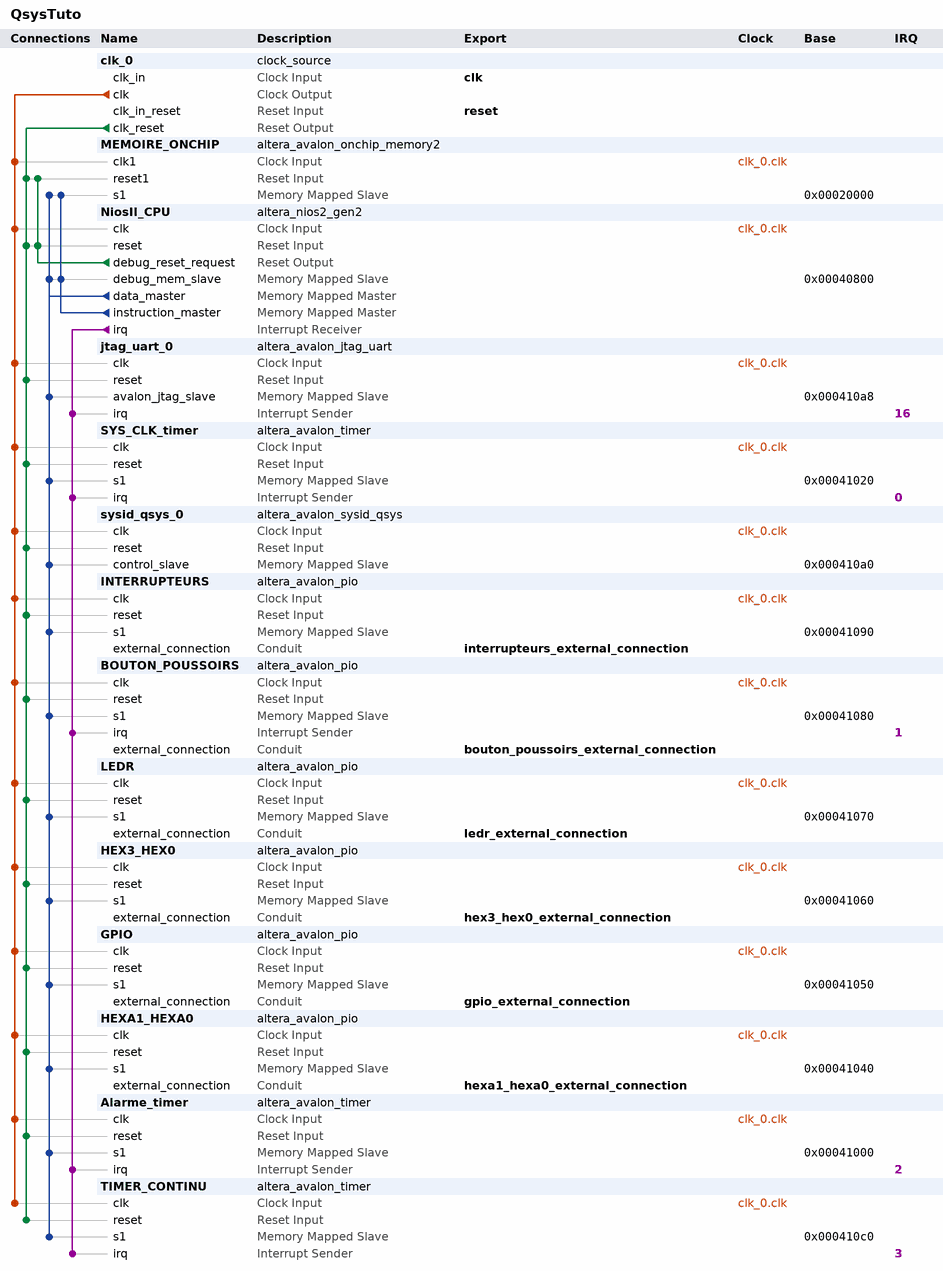
[diagram p0: system contents]
# Platform Designer (Qsys) system QsysTuto, MAX 10 10M50DAF484C6GES
# Parameters at their usual value, and those the tool derives, are not listed.
package require -exact qsys 18.1
create_system QsysTuto
set_project_property DEVICE_FAMILY {MAX 10}
set_project_property DEVICE 10M50DAF484C6GES

add_instance clk_0 clock_source 18.1
set_instance_parameter_value clk_0 clockFrequency 50000000

add_instance MEMOIRE_ONCHIP altera_avalon_onchip_memory2 18.1
set_instance_parameter_value MEMOIRE_ONCHIP dataWidth 32
set_instance_parameter_value MEMOIRE_ONCHIP dualPort false
set_instance_parameter_value MEMOIRE_ONCHIP initMemContent false
set_instance_parameter_value MEMOIRE_ONCHIP initializationFileName onchip_mem.hex
set_instance_parameter_value MEMOIRE_ONCHIP memorySize 122880

add_instance NiosII_CPU altera_nios2_gen2 18.1
set_instance_parameter_value NiosII_CPU dcache_size 0
set_instance_parameter_value NiosII_CPU exceptionSlave MEMOIRE_ONCHIP.s1
set_instance_parameter_value NiosII_CPU icache_size 2048
set_instance_parameter_value NiosII_CPU impl Fast
set_instance_parameter_value NiosII_CPU resetSlave MEMOIRE_ONCHIP.s1
set_instance_parameter_value NiosII_CPU setting_branchpredictiontype Static

add_instance jtag_uart_0 altera_avalon_jtag_uart 18.1
set_instance_parameter_value jtag_uart_0 simInteractiveOptions NO_INTERACTIVE_WINDOWS

add_instance SYS_CLK_timer altera_avalon_timer 18.1
set_instance_parameter_value SYS_CLK_timer period 1
set_instance_parameter_value SYS_CLK_timer periodUnits MSEC

add_instance sysid_qsys_0 altera_avalon_sysid_qsys 18.1
set_instance_parameter_value sysid_qsys_0 id 305419896

add_instance INTERRUPTEURS altera_avalon_pio 18.1
set_instance_parameter_value INTERRUPTEURS direction Input
set_instance_parameter_value INTERRUPTEURS width 10

add_instance BOUTON_POUSSOIRS altera_avalon_pio 18.1
set_instance_parameter_value BOUTON_POUSSOIRS captureEdge true
set_instance_parameter_value BOUTON_POUSSOIRS direction Input
set_instance_parameter_value BOUTON_POUSSOIRS edgeType FALLING
set_instance_parameter_value BOUTON_POUSSOIRS generateIRQ true
set_instance_parameter_value BOUTON_POUSSOIRS irqType EDGE
set_instance_parameter_value BOUTON_POUSSOIRS width 2

add_instance LEDR altera_avalon_pio 18.1
set_instance_parameter_value LEDR direction Output
set_instance_parameter_value LEDR resetValue 597
set_instance_parameter_value LEDR width 10

add_instance HEX3_HEX0 altera_avalon_pio 18.1
set_instance_parameter_value HEX3_HEX0 direction Output
set_instance_parameter_value HEX3_HEX0 resetValue 1077952576
set_instance_parameter_value HEX3_HEX0 width 32

add_instance GPIO altera_avalon_pio 18.1
set_instance_parameter_value GPIO direction Output
set_instance_parameter_value GPIO width 1

add_instance HEXA1_HEXA0 altera_avalon_pio 18.1
set_instance_parameter_value HEXA1_HEXA0 direction Output
set_instance_parameter_value HEXA1_HEXA0 resetValue 16448
set_instance_parameter_value HEXA1_HEXA0 width 16

add_instance Alarme_timer altera_avalon_timer 18.1
set_instance_parameter_value Alarme_timer period 1
set_instance_parameter_value Alarme_timer periodUnits MSEC

add_instance TIMER_CONTINU altera_avalon_timer 18.1
set_instance_parameter_value TIMER_CONTINU period 1
set_instance_parameter_value TIMER_CONTINU periodUnits MSEC

# connections
add_connection clk_0.clk Alarme_timer.clk clock
add_connection clk_0.clk BOUTON_POUSSOIRS.clk clock
add_connection clk_0.clk GPIO.clk clock
add_connection clk_0.clk HEX3_HEX0.clk clock
add_connection clk_0.clk HEXA1_HEXA0.clk clock
add_connection clk_0.clk INTERRUPTEURS.clk clock
add_connection clk_0.clk jtag_uart_0.clk clock
add_connection clk_0.clk LEDR.clk clock
add_connection clk_0.clk MEMOIRE_ONCHIP.clk1 clock
add_connection clk_0.clk NiosII_CPU.clk clock
add_connection clk_0.clk SYS_CLK_timer.clk clock
add_connection clk_0.clk sysid_qsys_0.clk clock
add_connection clk_0.clk TIMER_CONTINU.clk clock
add_connection clk_0.clk_reset Alarme_timer.reset reset
add_connection clk_0.clk_reset BOUTON_POUSSOIRS.reset reset
add_connection clk_0.clk_reset GPIO.reset reset
add_connection clk_0.clk_reset HEX3_HEX0.reset reset
add_connection clk_0.clk_reset HEXA1_HEXA0.reset reset
add_connection clk_0.clk_reset INTERRUPTEURS.reset reset
add_connection clk_0.clk_reset jtag_uart_0.reset reset
add_connection clk_0.clk_reset LEDR.reset reset
add_connection clk_0.clk_reset MEMOIRE_ONCHIP.reset1 reset
add_connection clk_0.clk_reset NiosII_CPU.reset reset
add_connection clk_0.clk_reset SYS_CLK_timer.reset reset
add_connection clk_0.clk_reset sysid_qsys_0.reset reset
add_connection clk_0.clk_reset TIMER_CONTINU.reset reset
add_connection NiosII_CPU.debug_reset_request MEMOIRE_ONCHIP.reset1 reset
add_connection NiosII_CPU.debug_reset_request NiosII_CPU.reset reset
add_connection NiosII_CPU.data_master Alarme_timer.s1 avalon
set_connection_parameter_value NiosII_CPU.data_master/Alarme_timer.s1 baseAddress 0x00041000
add_connection NiosII_CPU.data_master BOUTON_POUSSOIRS.s1 avalon
set_connection_parameter_value NiosII_CPU.data_master/BOUTON_POUSSOIRS.s1 baseAddress 0x00041080
add_connection NiosII_CPU.data_master GPIO.s1 avalon
set_connection_parameter_value NiosII_CPU.data_master/GPIO.s1 baseAddress 0x00041050
add_connection NiosII_CPU.data_master HEX3_HEX0.s1 avalon
set_connection_parameter_value NiosII_CPU.data_master/HEX3_HEX0.s1 baseAddress 0x00041060
add_connection NiosII_CPU.data_master HEXA1_HEXA0.s1 avalon
set_connection_parameter_value NiosII_CPU.data_master/HEXA1_HEXA0.s1 baseAddress 0x00041040
add_connection NiosII_CPU.data_master INTERRUPTEURS.s1 avalon
set_connection_parameter_value NiosII_CPU.data_master/INTERRUPTEURS.s1 baseAddress 0x00041090
add_connection NiosII_CPU.data_master jtag_uart_0.avalon_jtag_slave avalon
set_connection_parameter_value NiosII_CPU.data_master/jtag_uart_0.avalon_jtag_slave baseAddress 0x000410a8
add_connection NiosII_CPU.data_master LEDR.s1 avalon
set_connection_parameter_value NiosII_CPU.data_master/LEDR.s1 baseAddress 0x00041070
add_connection NiosII_CPU.data_master MEMOIRE_ONCHIP.s1 avalon
set_connection_parameter_value NiosII_CPU.data_master/MEMOIRE_ONCHIP.s1 baseAddress 0x00020000
add_connection NiosII_CPU.data_master NiosII_CPU.debug_mem_slave avalon
set_connection_parameter_value NiosII_CPU.data_master/NiosII_CPU.debug_mem_slave baseAddress 0x00040800
add_connection NiosII_CPU.data_master SYS_CLK_timer.s1 avalon
set_connection_parameter_value NiosII_CPU.data_master/SYS_CLK_timer.s1 baseAddress 0x00041020
add_connection NiosII_CPU.data_master sysid_qsys_0.control_slave avalon
set_connection_parameter_value NiosII_CPU.data_master/sysid_qsys_0.control_slave baseAddress 0x000410a0
add_connection NiosII_CPU.data_master TIMER_CONTINU.s1 avalon
set_connection_parameter_value NiosII_CPU.data_master/TIMER_CONTINU.s1 baseAddress 0x000410c0
add_connection NiosII_CPU.instruction_master MEMOIRE_ONCHIP.s1 avalon
set_connection_parameter_value NiosII_CPU.instruction_master/MEMOIRE_ONCHIP.s1 baseAddress 0x00020000
add_connection NiosII_CPU.instruction_master NiosII_CPU.debug_mem_slave avalon
set_connection_parameter_value NiosII_CPU.instruction_master/NiosII_CPU.debug_mem_slave baseAddress 0x00040800
add_connection NiosII_CPU.irq Alarme_timer.irq interrupt
set_connection_parameter_value NiosII_CPU.irq/Alarme_timer.irq irqNumber 2
add_connection NiosII_CPU.irq BOUTON_POUSSOIRS.irq interrupt
set_connection_parameter_value NiosII_CPU.irq/BOUTON_POUSSOIRS.irq irqNumber 1
add_connection NiosII_CPU.irq jtag_uart_0.irq interrupt
set_connection_parameter_value NiosII_CPU.irq/jtag_uart_0.irq irqNumber 16
add_connection NiosII_CPU.irq SYS_CLK_timer.irq interrupt
set_connection_parameter_value NiosII_CPU.irq/SYS_CLK_timer.irq irqNumber 0
add_connection NiosII_CPU.irq TIMER_CONTINU.irq interrupt
set_connection_parameter_value NiosII_CPU.irq/TIMER_CONTINU.irq irqNumber 3

# exported interfaces
add_interface bouton_poussoirs_external_connection conduit end
set_interface_property bouton_poussoirs_external_connection EXPORT_OF BOUTON_POUSSOIRS.external_connection
add_interface clk clock sink
set_interface_property clk EXPORT_OF clk_0.clk_in
add_interface gpio_external_connection conduit end
set_interface_property gpio_external_connection EXPORT_OF GPIO.external_connection
add_interface hex3_hex0_external_connection conduit end
set_interface_property hex3_hex0_external_connection EXPORT_OF HEX3_HEX0.external_connection
add_interface hexa1_hexa0_external_connection conduit end
set_interface_property hexa1_hexa0_external_connection EXPORT_OF HEXA1_HEXA0.external_connection
add_interface interrupteurs_external_connection conduit end
set_interface_property interrupteurs_external_connection EXPORT_OF INTERRUPTEURS.external_connection
add_interface ledr_external_connection conduit end
set_interface_property ledr_external_connection EXPORT_OF LEDR.external_connection
add_interface reset reset sink
set_interface_property reset EXPORT_OF clk_0.clk_in_reset

set_interconnect_requirement {$system} qsys_mm.clockCrossingAdapter HANDSHAKE
set_interconnect_requirement {$system} qsys_mm.enableEccProtection FALSE
set_interconnect_requirement {$system} qsys_mm.insertDefaultSlave FALSE
set_interconnect_requirement {$system} qsys_mm.maxAdditionalLatency 1

save_system QsysTuto.qsys
